# Altium schematic sheet 02.C210. A01-A24. Module BASU Optics Vertical motor.SchDoc: Кабель двигателя ВН оптики
size 209 x 297 mm; Author: Мурашкин Д.В.; Address1: Address1; Address2: Address2; Address3: Address3; Address4: Address4; DocumentNumber: ИЗДЕЛИЕ-1-2; SheetNumber: 22; Scale: 1:1; Letter1Column: Э
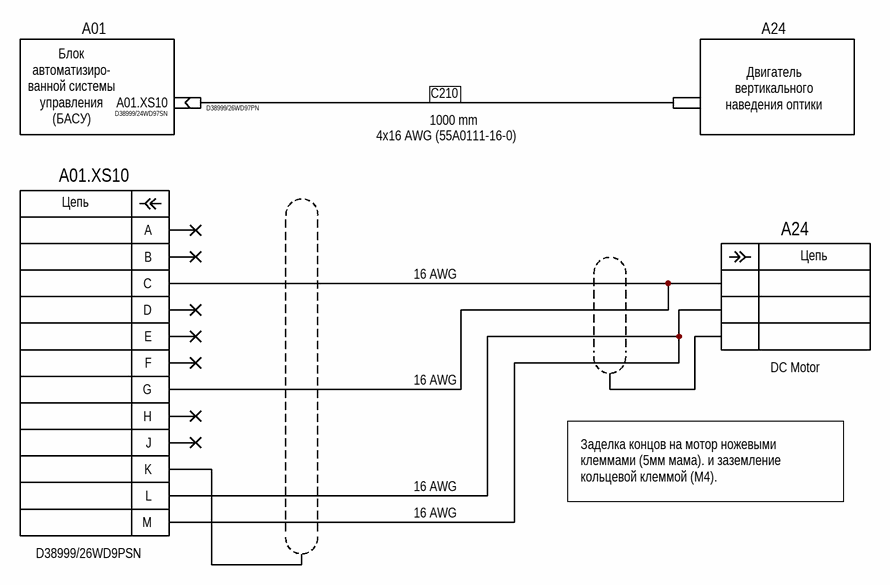
[diagram p0: 02.C210. A01-A24. Module BASU Optics Vertical motor.SchDoc]

## Parts
(Parts that share a designator on the sheet are numbered #1, #2 ... from top to bottom, then left to right.)
A01.XS10#1  D38999/24WD97SN
A01.XS10#2  D38999/26WD9PSN
A24  DC Motor
A?#1  D38999/26WD97PN
A?#2  Провод  (value not drawn)  (no BOM)

## Nets
С210: A?#1.0 A?#2.0
NetA01.XS10#2_C: A01.XS10#2.C A01.XS10#2.G A24.?2
NetA01.XS10#2_L: A01.XS10#2.L A01.XS10#2.M A24.?1

Not connected (* = marked no-connect by the designer): A01.XS10#1 0; A01.XS10#2 A* B* D* E* F* H* J* K; A24 ?3

## Notes on the sheet
- A01
- A24
- (near A?#2) Двигатель вертикального наведения оптики
- Блок автоматизиро- ванной системы управления (БАСУ)
- 4x16 AWG (55A0111-16-0)
- 1000 mm
- 16 AWG
- Заделка концов на мотор ножевыми клеммами (5мм мама). и заземление кольцевой клеммой (М4).
- Перв. примен.
- Справ. №
- Подп. и дата
- Инв. № дубл.
- Взам. инв. №
- Инв. № подл.
- Изм.
- Лист
- № докум.
- Подп.
- Дата
- 2.106-A4
- Копировал
- Формат А4
- (in symbol Connector signal P5_1_1_1) Цепь
- (in symbol Connector signal P12 MIL) Цепь

## Library data of the parts
A01.XS10#1 = Connector cable socket: Part name: D38999/24WD97SN; Operating temperature: -°C +°C; Mounting type: Surface mount; Dimension: .0mm x .0mm; Height: .0mm
A01.XS10#2 = Connector signal P12 MIL: P12 MIL; Operating temperature: -°C +°C; Mounting type: Surface mount; Dimension: .0mm x .0mm; Height: .0mm
A24 = Connector signal P5_1_1_1: Part name: DC Motor; Operating temperature: -°C +°C; Mounting type: Surface mount; Dimension: .0mm x .0mm; Height: .0mm
A?#1 = Connector cable plug: Part name: D38999/26WD97PN; Operating temperature: -°C +°C; Mounting type: Surface mount; Dimension: .0mm x .0mm; Height: .0mm
A?#2 = Connector cable coupling: Operating temperature: -°C +°C; Mounting type: Surface mount; Dimension: .0mm x .0mm; Height: .0mm